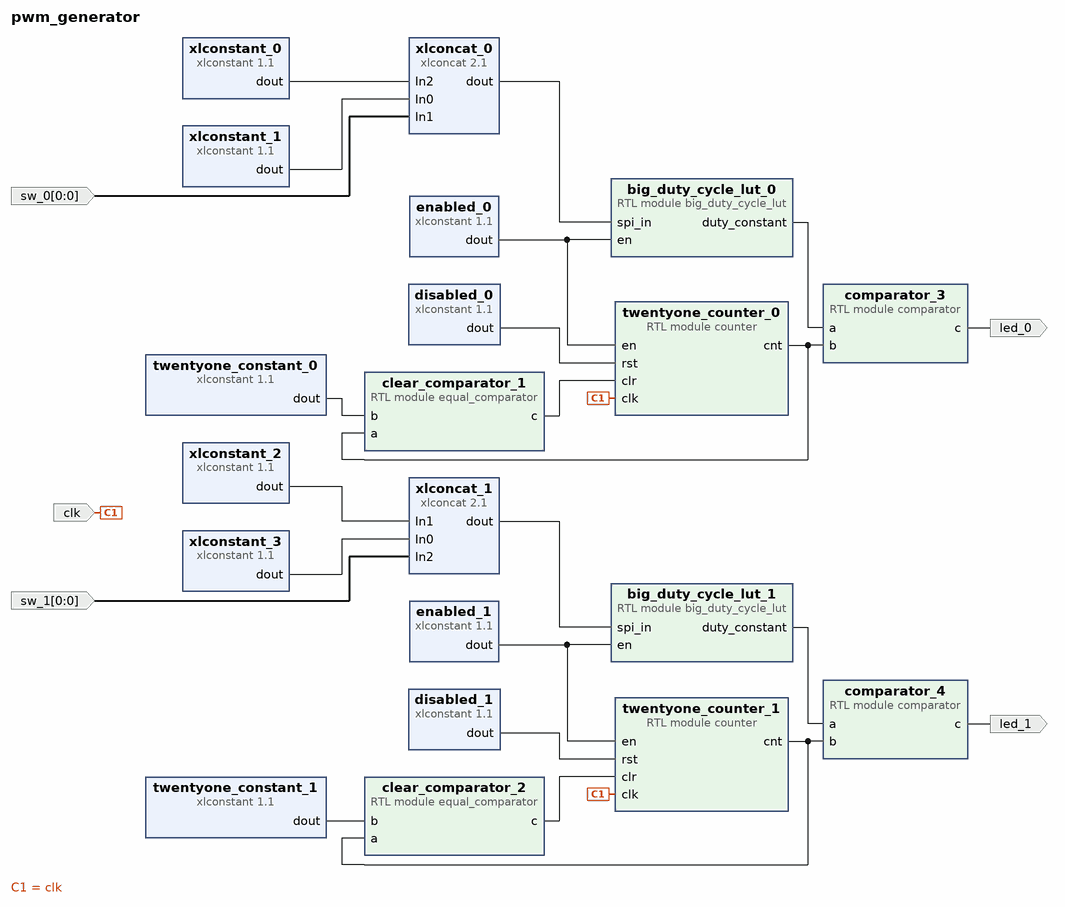
[diagram p0: block diagram of the top level]
# Vivado block design pwm_generator, xc7z020clg400-1, Vivado 2024.2
create_bd_design pwm_generator

create_bd_port -dir I -type clk clk
create_bd_port -dir O led_0
create_bd_port -dir O led_1
create_bd_port -dir I -from 0 -to 0 sw_0
create_bd_port -dir I -from 0 -to 0 sw_1

create_bd_cell -type ip -vlnv xilinx.com:ip:xlconstant:1.1 enabled_0
create_bd_cell -type ip -vlnv xilinx.com:ip:xlconstant:1.1 disabled_0
set_property -dict {CONFIG.CONST_VAL 0} [get_bd_cells disabled_0]
create_bd_cell -type module -reference counter twentyone_counter_0
set_property -dict {CONFIG.n_bits 5} [get_bd_cells twentyone_counter_0]
create_bd_cell -type ip -vlnv xilinx.com:ip:xlconstant:1.1 twentyone_constant_0
set_property -dict {CONFIG.CONST_VAL 20 CONFIG.CONST_WIDTH 5} [get_bd_cells twentyone_constant_0]
create_bd_cell -type module -reference equal_comparator clear_comparator_1
set_property -dict {CONFIG.n_bits 5} [get_bd_cells clear_comparator_1]
create_bd_cell -type module -reference big_duty_cycle_lut big_duty_cycle_lut_0
create_bd_cell -type module -reference comparator comparator_3
set_property -dict {CONFIG.n_bits 5} [get_bd_cells comparator_3]
create_bd_cell -type module -reference big_duty_cycle_lut big_duty_cycle_lut_1
create_bd_cell -type module -reference equal_comparator clear_comparator_2
set_property -dict {CONFIG.n_bits 5} [get_bd_cells clear_comparator_2]
create_bd_cell -type module -reference comparator comparator_4
set_property -dict {CONFIG.n_bits 5} [get_bd_cells comparator_4]
create_bd_cell -type ip -vlnv xilinx.com:ip:xlconstant:1.1 disabled_1
set_property -dict {CONFIG.CONST_VAL 0} [get_bd_cells disabled_1]
create_bd_cell -type ip -vlnv xilinx.com:ip:xlconstant:1.1 enabled_1
create_bd_cell -type ip -vlnv xilinx.com:ip:xlconstant:1.1 twentyone_constant_1
set_property -dict {CONFIG.CONST_VAL 20 CONFIG.CONST_WIDTH 5} [get_bd_cells twentyone_constant_1]
create_bd_cell -type module -reference counter twentyone_counter_1
set_property -dict {CONFIG.n_bits 5} [get_bd_cells twentyone_counter_1]
create_bd_cell -type ip -vlnv xilinx.com:ip:xlconstant:1.1 xlconstant_0
set_property -dict {CONFIG.CONST_VAL 2 CONFIG.CONST_WIDTH 2} [get_bd_cells xlconstant_0]
create_bd_cell -type ip -vlnv xilinx.com:ip:xlconstant:1.1 xlconstant_1
set_property -dict {CONFIG.CONST_VAL 0 CONFIG.CONST_WIDTH 2} [get_bd_cells xlconstant_1]
create_bd_cell -type ip -vlnv xilinx.com:ip:xlconcat:2.1 xlconcat_0
set_property -dict {CONFIG.IN0_WIDTH 2 CONFIG.IN1_WIDTH 1 CONFIG.IN2_WIDTH 2 CONFIG.NUM_PORTS 3} [get_bd_cells xlconcat_0]
create_bd_cell -type ip -vlnv xilinx.com:ip:xlconcat:2.1 xlconcat_1
set_property -dict {CONFIG.IN0_WIDTH 2 CONFIG.IN1_WIDTH 2 CONFIG.IN2_WIDTH 1 CONFIG.NUM_PORTS 3} [get_bd_cells xlconcat_1]
create_bd_cell -type ip -vlnv xilinx.com:ip:xlconstant:1.1 xlconstant_2
set_property -dict {CONFIG.CONST_VAL 0 CONFIG.CONST_WIDTH 2} [get_bd_cells xlconstant_2]
create_bd_cell -type ip -vlnv xilinx.com:ip:xlconstant:1.1 xlconstant_3
set_property -dict {CONFIG.CONST_VAL 3 CONFIG.CONST_WIDTH 2} [get_bd_cells xlconstant_3]

# ---- connections ----

connect_bd_net -net In1_0_1 [get_bd_ports sw_0] [get_bd_pins xlconcat_0/In1]
connect_bd_net [get_bd_pins big_duty_cycle_lut_0/duty_constant] [get_bd_pins comparator_3/a]
connect_bd_net -net big_duty_cycle_lut_0_duty_constant1 [get_bd_pins big_duty_cycle_lut_1/duty_constant] [get_bd_pins comparator_4/a]
connect_bd_net -net clk_0_1 [get_bd_ports clk] [get_bd_pins twentyone_counter_0/clk] [get_bd_pins twentyone_counter_1/clk]
connect_bd_net [get_bd_pins comparator_3/c] [get_bd_ports led_0]
connect_bd_net -net comparator_3_c1 [get_bd_pins comparator_4/c] [get_bd_ports led_1]
connect_bd_net [get_bd_pins disabled_0/dout] [get_bd_pins twentyone_counter_0/rst]
connect_bd_net -net disabled_0_dout1 [get_bd_pins disabled_1/dout] [get_bd_pins twentyone_counter_1/rst]
connect_bd_net -net four_constant_0_dout [get_bd_pins twentyone_constant_0/dout] [get_bd_pins clear_comparator_1/b]
connect_bd_net -net four_constant_0_dout1 [get_bd_pins twentyone_constant_1/dout] [get_bd_pins clear_comparator_2/b]
connect_bd_net -net four_counter_0_cnt [get_bd_pins twentyone_counter_0/cnt] [get_bd_pins clear_comparator_1/a] [get_bd_pins comparator_3/b]
connect_bd_net -net four_counter_0_cnt1 [get_bd_pins twentyone_counter_1/cnt] [get_bd_pins clear_comparator_2/a] [get_bd_pins comparator_4/b]
connect_bd_net -net reset_comparator_2_c [get_bd_pins clear_comparator_1/c] [get_bd_pins twentyone_counter_0/clr]
connect_bd_net -net reset_comparator_2_c1 [get_bd_pins clear_comparator_2/c] [get_bd_pins twentyone_counter_1/clr]
connect_bd_net -net sw_1_1 [get_bd_ports sw_1] [get_bd_pins xlconcat_1/In2]
connect_bd_net [get_bd_pins xlconcat_0/dout] [get_bd_pins big_duty_cycle_lut_0/spi_in]
connect_bd_net [get_bd_pins xlconcat_1/dout] [get_bd_pins big_duty_cycle_lut_1/spi_in]
connect_bd_net -net xlconstant_0_dout [get_bd_pins enabled_0/dout] [get_bd_pins twentyone_counter_0/en] [get_bd_pins big_duty_cycle_lut_0/en]
connect_bd_net -net xlconstant_0_dout1 [get_bd_pins enabled_1/dout] [get_bd_pins twentyone_counter_1/en] [get_bd_pins big_duty_cycle_lut_1/en]
connect_bd_net [get_bd_pins xlconstant_0/dout] [get_bd_pins xlconcat_0/In2]
connect_bd_net [get_bd_pins xlconstant_1/dout] [get_bd_pins xlconcat_0/In0]
connect_bd_net [get_bd_pins xlconstant_2/dout] [get_bd_pins xlconcat_1/In1]
connect_bd_net [get_bd_pins xlconstant_3/dout] [get_bd_pins xlconcat_1/In0]

validate_bd_design
save_bd_design
